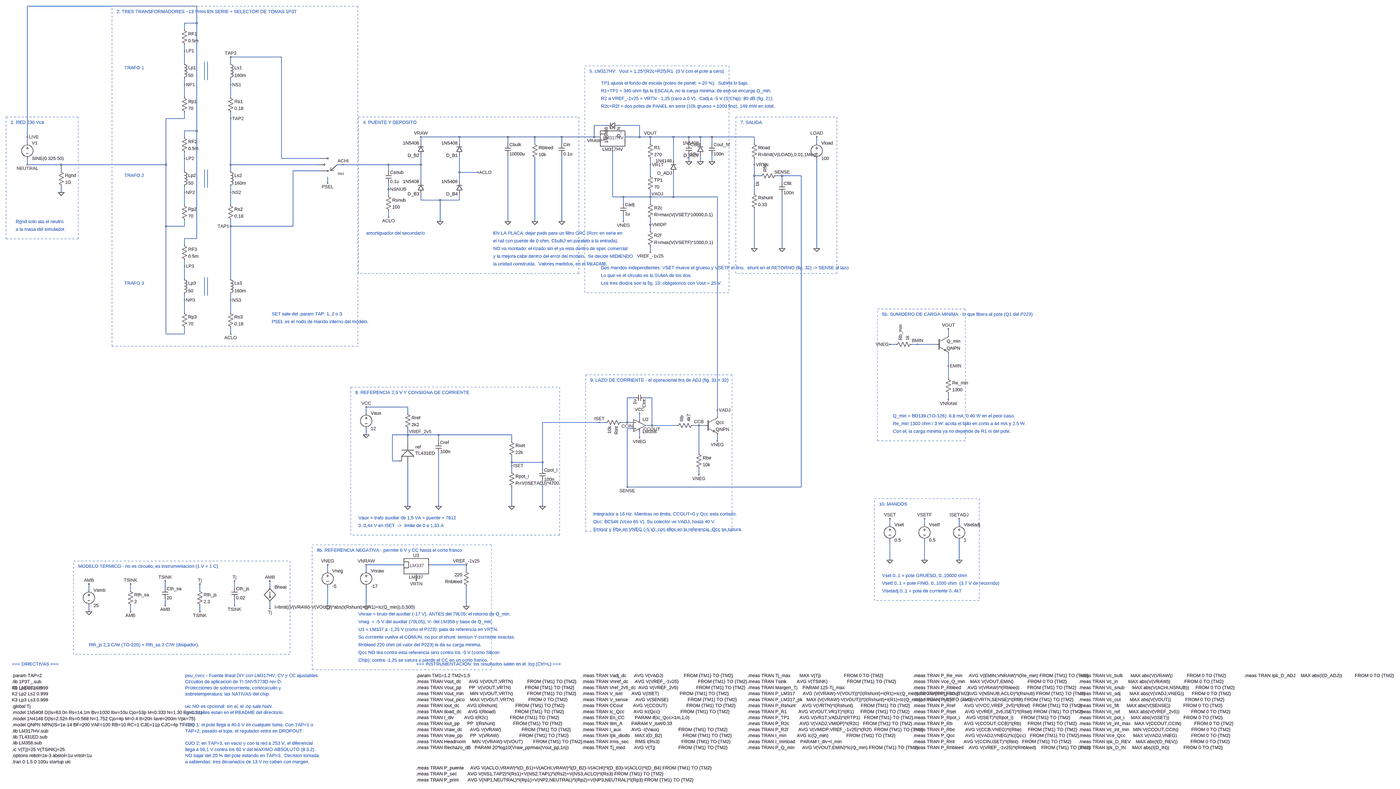
[diagram p0: schematic psu_cvcc.asc, whole sheet]
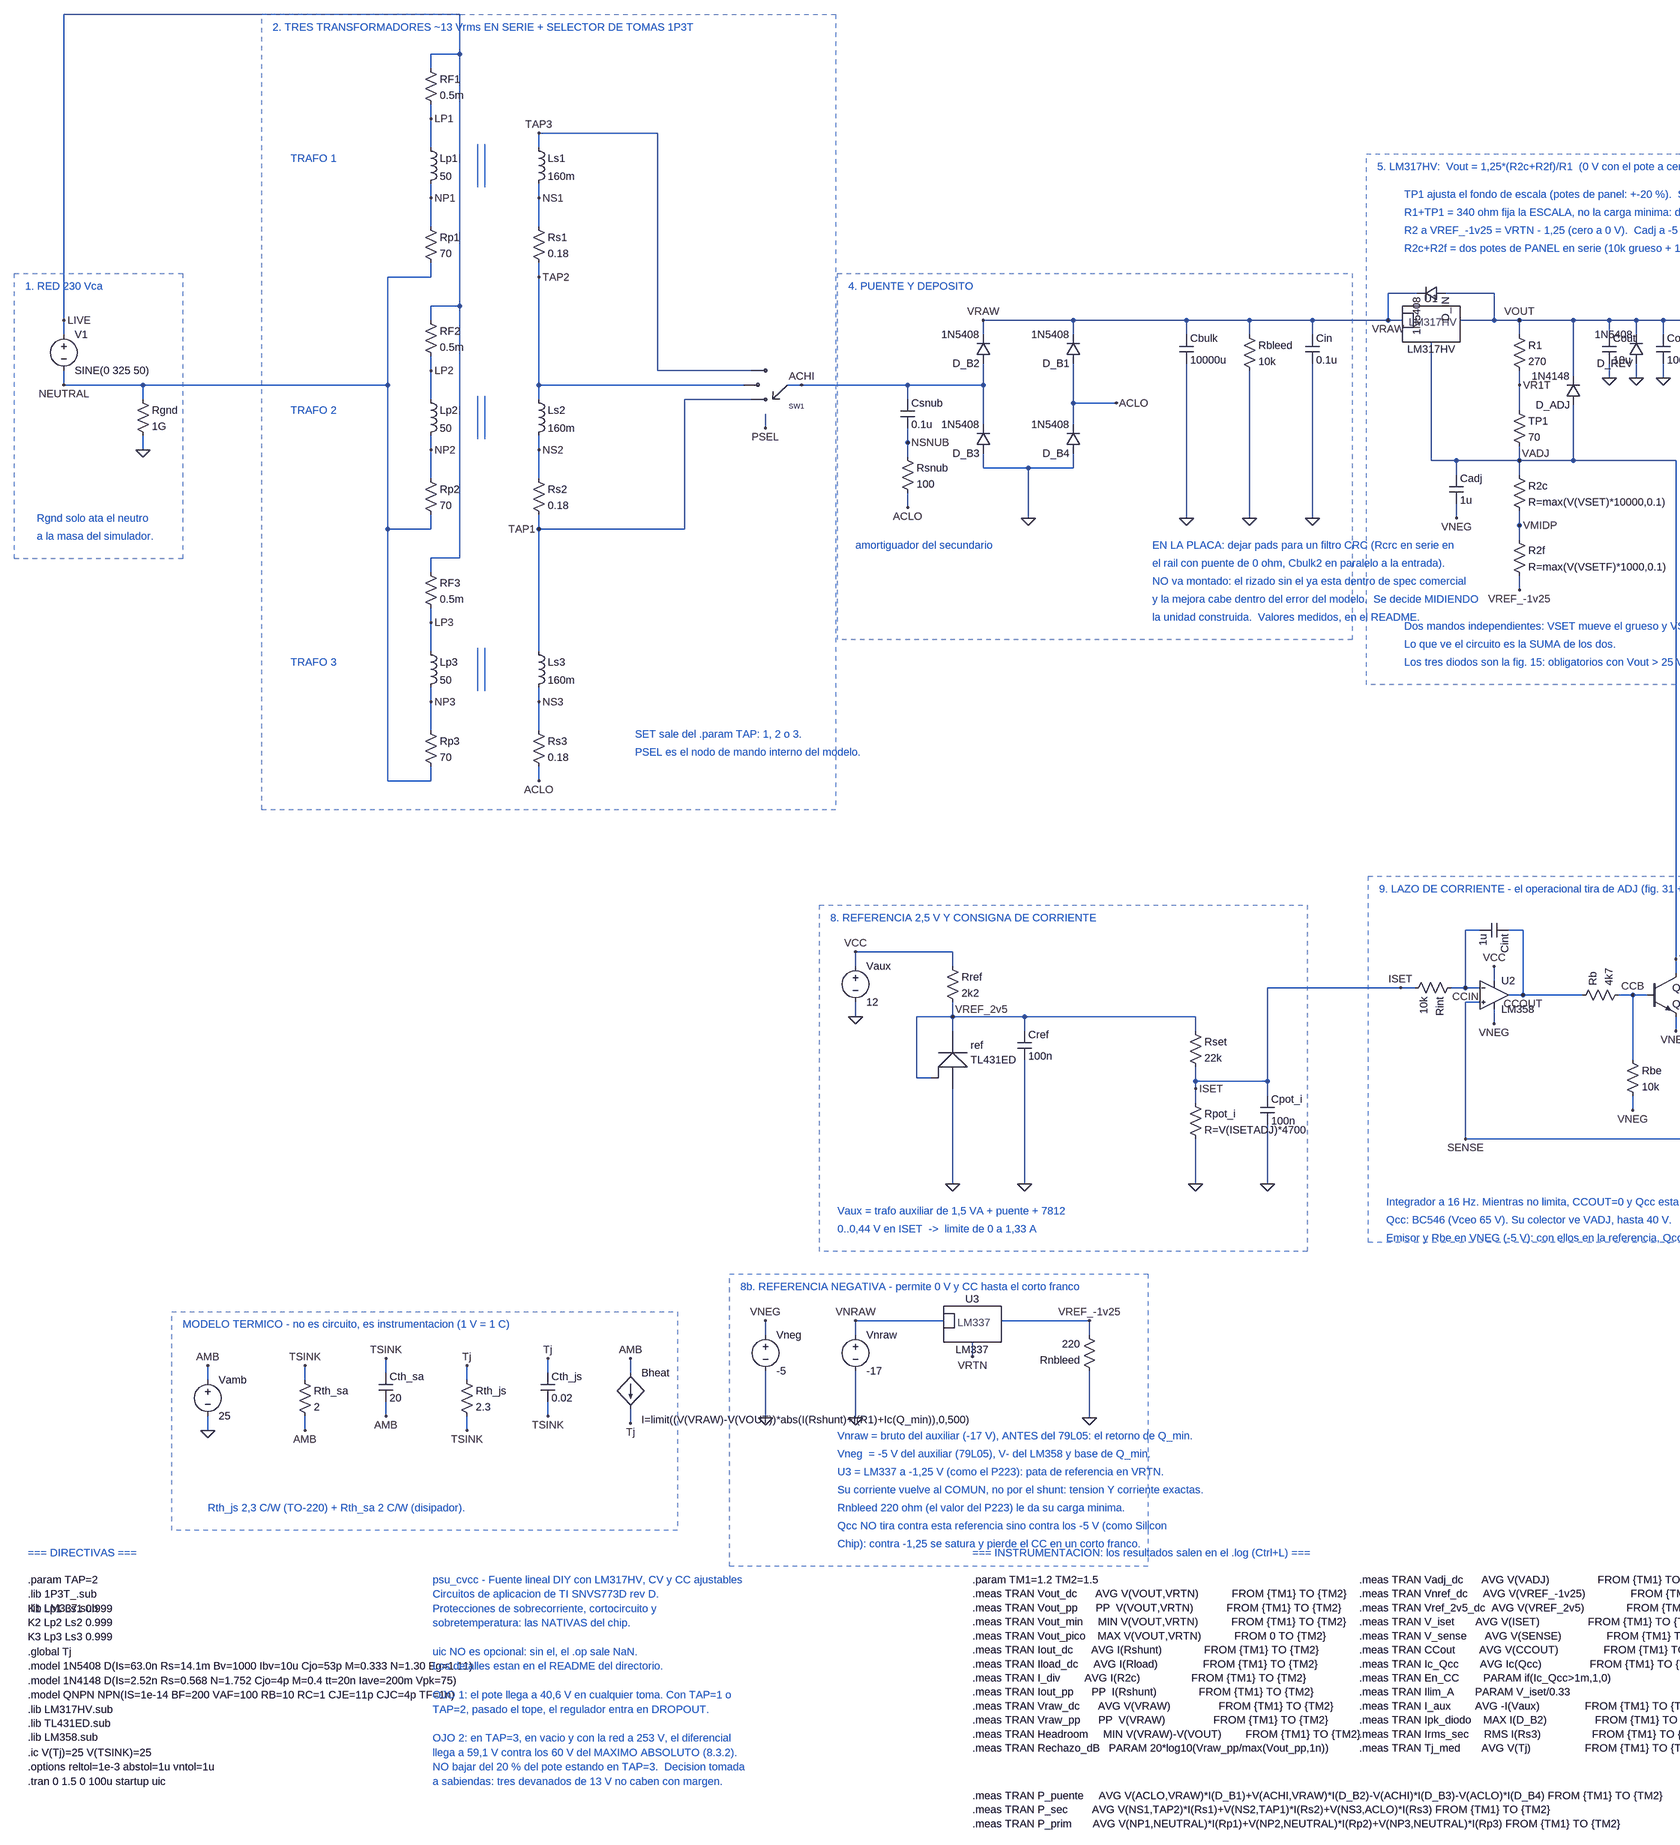
[diagram p1: schematic psu_cvcc.asc, part, row 1 of 1, column 1 of 2]
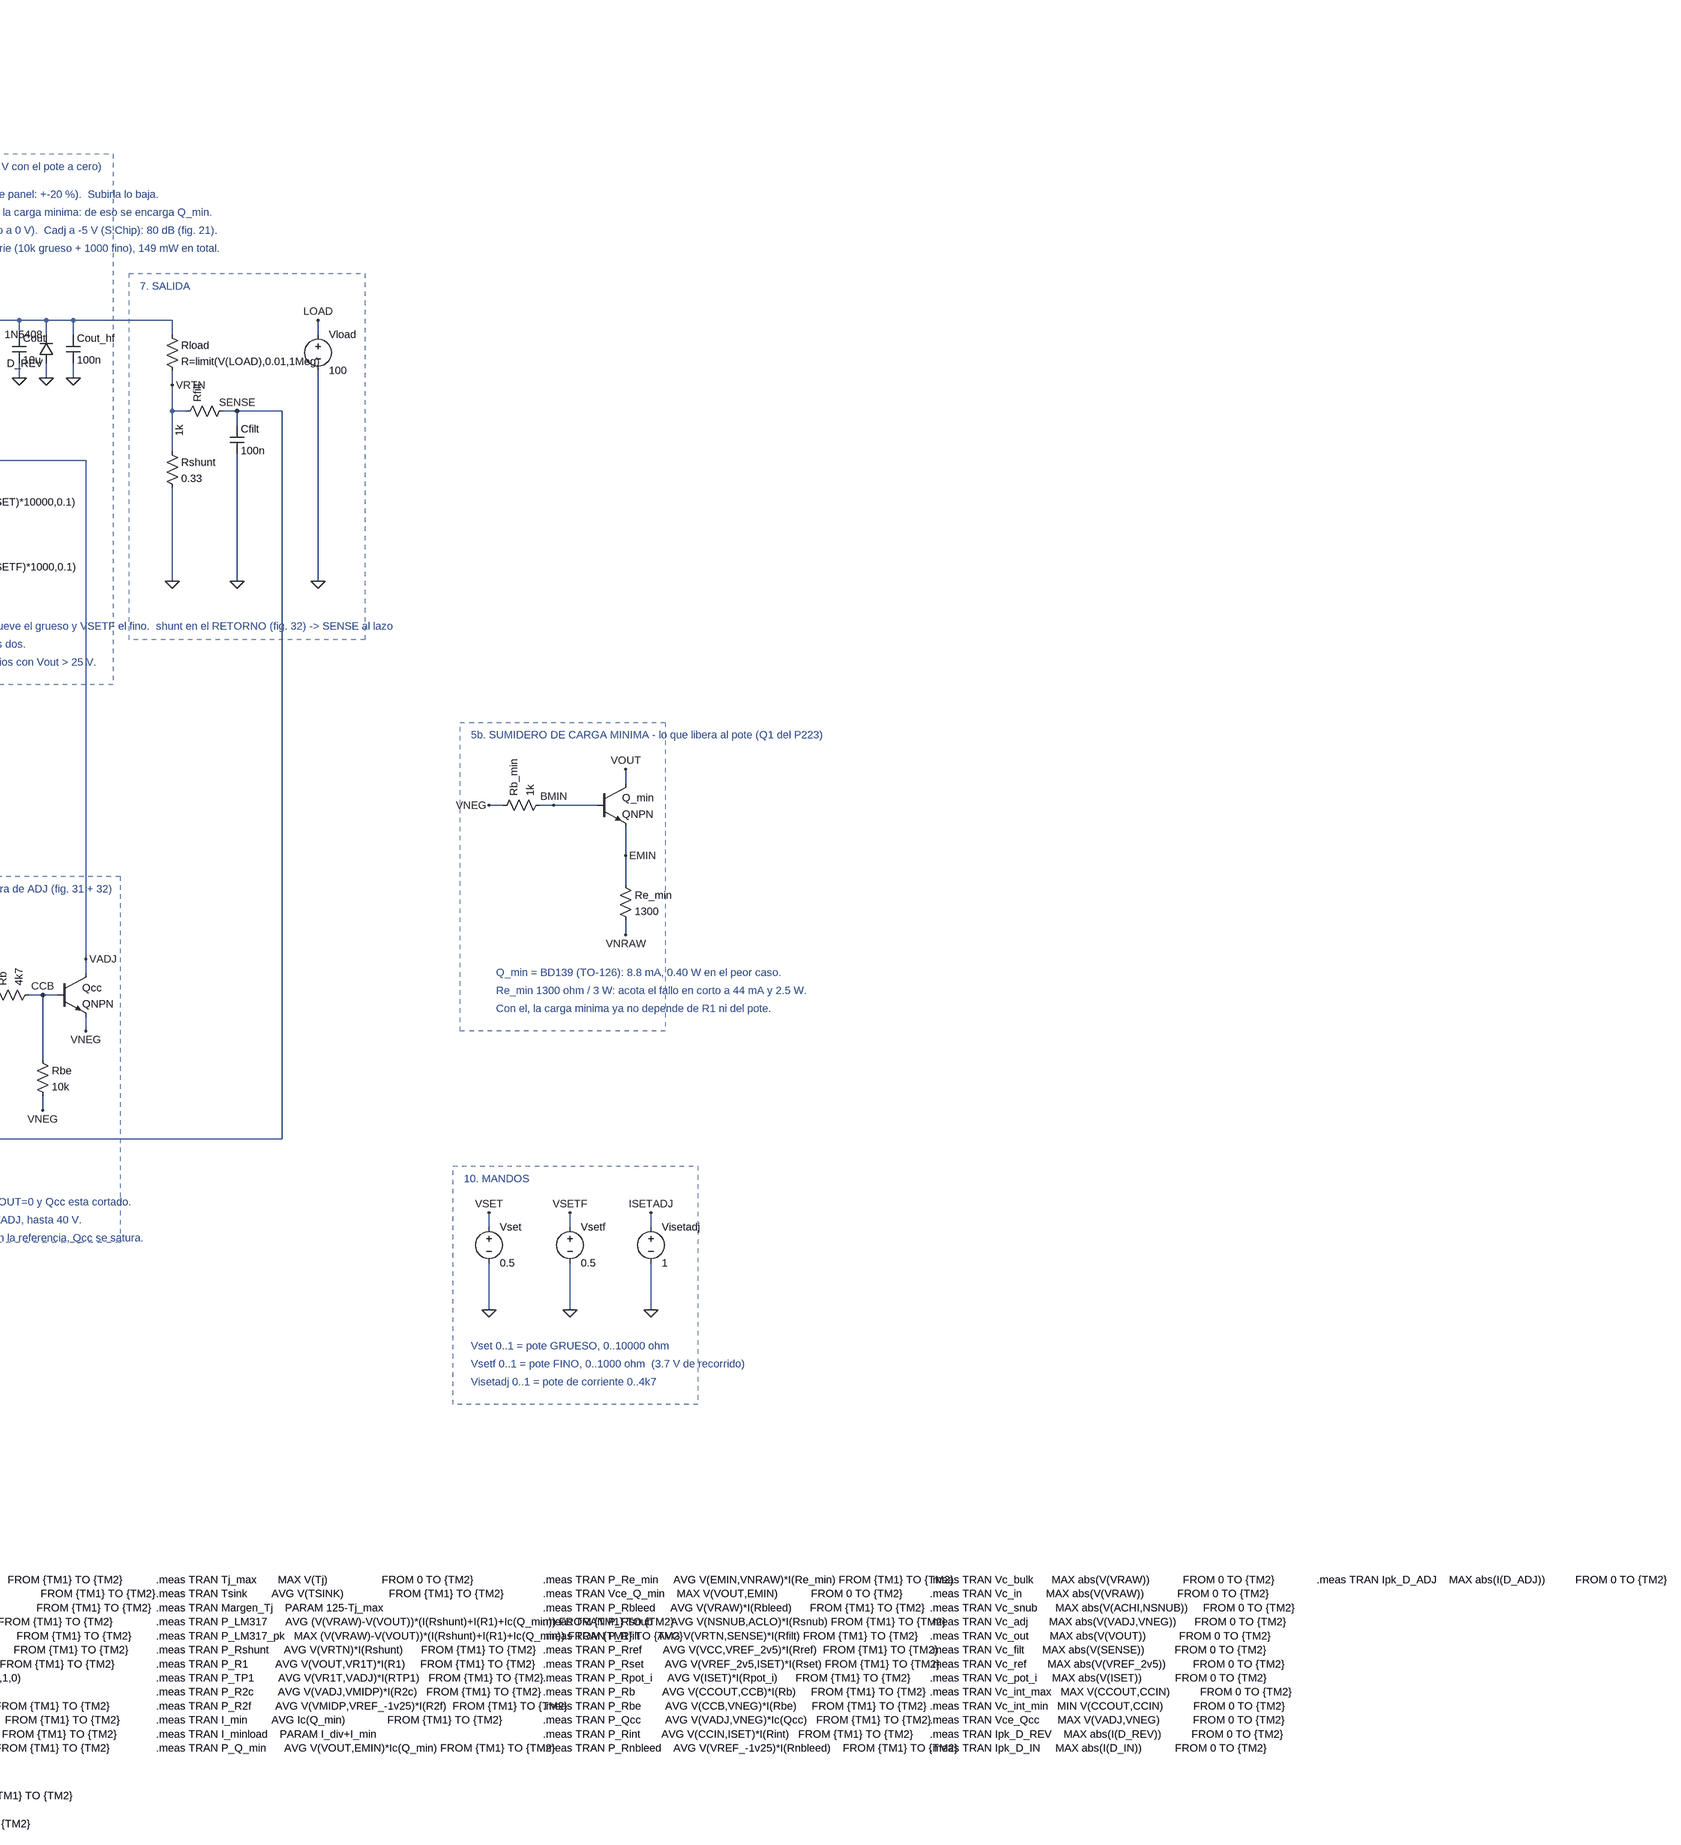
[diagram p2: schematic psu_cvcc.asc, part, row 1 of 1, column 2 of 2]
psu_cvcc.asc, the LTspice schematic file:
Version 4
SHEET 1 5200 4400
WIRE -320 592 -320 560
WIRE -320 672 -320 704
WIRE -144 736 -144 704
WIRE -144 816 -144 848
WIRE 496 0 496 -32
WIRE 496 80 496 112
WIRE 496 176 496 144
WIRE 496 256 496 288
WIRE 496 352 496 320
WIRE 496 432 496 464
WIRE 736 176 736 144
WIRE 736 256 736 288
WIRE 736 352 736 320
WIRE 736 432 736 464
WIRE 496 112 496 144
WIRE 496 288 496 320
WIRE 736 288 736 320
WIRE 496 560 496 528
WIRE 496 640 496 672
WIRE 496 736 496 704
WIRE 496 816 496 848
WIRE 496 912 496 880
WIRE 496 992 496 1024
WIRE 736 736 736 704
WIRE 736 816 736 848
WIRE 736 912 736 880
WIRE 736 992 736 1024
WIRE 496 672 496 704
WIRE 496 848 496 880
WIRE 736 848 736 880
WIRE 496 1120 496 1088
WIRE 496 1200 496 1232
WIRE 496 1296 496 1264
WIRE 496 1376 496 1408
WIRE 496 1472 496 1440
WIRE 496 1552 496 1584
WIRE 736 1296 736 1264
WIRE 736 1376 736 1408
WIRE 736 1472 736 1440
WIRE 736 1552 736 1584
WIRE 496 1232 496 1264
WIRE 496 1408 496 1440
WIRE 736 1408 736 1440
WIRE 400 464 400 704
WIRE 400 704 400 1024
WIRE 400 1024 400 1584
WIRE 560 -32 560 528
WIRE 560 528 560 1088
WIRE 560 -32 496 -32
WIRE 400 464 496 464
WIRE 560 528 496 528
WIRE 400 1024 496 1024
WIRE 560 1088 496 1088
WIRE 400 1584 496 1584
WIRE 736 464 736 704
WIRE 736 1024 736 1264
WIRE 1288 704 1320 704
WIRE 1208 736 1176 736
WIRE 1192 704 1160 704
WIRE 1208 672 1176 672
WIRE 1240 768 1240 800
WIRE 736 144 1000 144
WIRE 1000 144 1000 672
WIRE 1000 672 1176 672
WIRE 736 704 1160 704
WIRE 736 1024 1060 1024
WIRE 1060 1024 1060 736
WIRE 1060 736 1176 736
WIRE 1724 656 1724 688
WIRE 1724 592 1724 560
WIRE 1724 856 1724 888
WIRE 1724 792 1724 760
WIRE 1924 656 1924 688
WIRE 1924 592 1924 560
WIRE 1924 856 1924 888
WIRE 1924 792 1924 760
WIRE 2176 592 2176 560
WIRE 2176 656 2176 688
WIRE 2316 592 2316 560
WIRE 2316 672 2316 704
WIRE 2456 592 2456 560
WIRE 2456 656 2456 688
WIRE 1724 760 1724 704
WIRE 1724 704 1724 688
WIRE 1924 760 1924 744
WIRE 1924 744 1924 688
WIRE 1924 744 2020 744
WIRE 1724 560 1924 560
WIRE 1924 560 2176 560
WIRE 2176 560 2316 560
WIRE 2316 560 2456 560
WIRE 1724 888 1824 888
WIRE 1824 888 1924 888
WIRE 1824 888 1824 1000
WIRE 2176 688 2176 1000
WIRE 2316 704 2316 1000
WIRE 2456 688 2456 1000
WIRE 1556 736 1556 704
WIRE 1556 800 1556 832
WIRE 1556 864 1556 832
WIRE 1556 944 1556 976
WIRE 1556 832 1556 832
WIRE 2720 608 2720 640
WIRE 2784 560 2816 560
WIRE 2656 560 2624 560
WIRE 2916 592 2916 560
WIRE 2916 672 2916 704
WIRE 2916 760 2916 728
WIRE 2916 840 2916 872
WIRE 2916 904 2916 872
WIRE 2916 984 2916 1016
WIRE 2916 1048 2916 1016
WIRE 2916 1128 2916 1160
WIRE 2776 904 2776 872
WIRE 2776 968 2776 1000
WIRE 2916 704 2916 728
WIRE 2916 872 2916 872
WIRE 2916 1016 2916 1016
WIRE 2720 640 2720 872
WIRE 2720 872 2776 872
WIRE 3116 592 3116 560
WIRE 3116 656 3116 688
WIRE 3236 592 3236 560
WIRE 3236 656 3236 688
WIRE 2752 500 2784 500
WIRE 2688 500 2656 500
WIRE 3036 748 3036 780
WIRE 3036 684 3036 652
WIRE 3176 656 3176 688
WIRE 3176 592 3176 560
WIRE 2816 560 2860 560
WIRE 2860 560 2916 560
WIRE 2916 560 3036 560
WIRE 3036 560 3116 560
WIRE 3116 560 3176 560
WIRE 3176 560 3236 560
WIRE 3036 560 3036 652
WIRE 2860 560 2860 500
WIRE 2860 500 2784 500
WIRE 2656 500 2624 500
WIRE 2624 500 2624 560
WIRE 2776 872 2916 872
WIRE 2916 872 3036 872
WIRE 3036 872 3036 780
WIRE 4192 1638 4160 1638
WIRE 4272 1638 4304 1638
WIRE 4464 1590 4464 1558
WIRE 4400 1638 4368 1638
WIRE 4464 1686 4464 1718
WIRE 4464 1814 4464 1782
WIRE 4464 1894 4464 1926
WIRE 4304 1638 4368 1638
WIRE 4464 1718 4464 1750
WIRE 4464 1750 4464 1782
WIRE 3456 592 3456 560
WIRE 3456 672 3456 704
WIRE 3456 852 3456 820
WIRE 3456 932 3456 964
WIRE 3488 762 3456 762
WIRE 3568 762 3600 762
WIRE 3600 794 3600 762
WIRE 3600 858 3600 890
WIRE 3780 592 3780 560
WIRE 3780 672 3780 704
WIRE 3456 704 3456 762
WIRE 3456 762 3456 820
WIRE 3456 762 3456 762
WIRE 3600 762 3600 762
WIRE 3456 964 3456 1140
WIRE 3600 890 3600 1140
WIRE 3780 704 3780 1140
WIRE 1440 1996 1440 1964
WIRE 1440 2076 1440 2108
WIRE 1656 1996 1656 1964
WIRE 1656 2076 1656 2108
WIRE 1656 2140 1656 2108
WIRE 1656 2268 1656 2300
WIRE 1608 2244 1576 2244
WIRE 1816 2140 1816 2108
WIRE 1816 2204 1816 2236
WIRE 2196 2140 2196 2108
WIRE 2196 2220 2196 2252
WIRE 2196 2300 2196 2268
WIRE 2196 2380 2196 2412
WIRE 2356 2284 2356 2252
WIRE 2356 2348 2356 2380
WIRE 1440 1964 1656 1964
WIRE 1656 2108 1656 2108
WIRE 1656 2108 1816 2108
WIRE 1816 2108 2196 2108
WIRE 1576 2244 1576 2108
WIRE 1576 2108 1656 2108
WIRE 2196 2252 2196 2268
WIRE 2196 2252 2356 2252
WIRE 1656 2300 1656 2480
WIRE 1816 2236 1816 2480
WIRE 2196 2412 2196 2480
WIRE 2356 2380 2356 2480
WIRE 3264 2012 3264 1980
WIRE 3200 2060 3168 2060
WIRE 3264 2108 3264 2140
WIRE 3056 2060 3024 2060
WIRE 3136 2060 3168 2060
WIRE 2828 2076 2796 2076
WIRE 2828 2044 2796 2044
WIRE 2860 2028 2860 1996
WIRE 2860 2092 2860 2124
WIRE 2892 2060 2924 2060
WIRE 2764 2044 2796 2044
WIRE 2684 2044 2652 2044
WIRE 2892 1916 2924 1916
WIRE 2828 1916 2796 1916
WIRE 3168 2204 3168 2172
WIRE 3168 2284 3168 2316
WIRE 2924 1916 2924 2060
WIRE 2796 1916 2796 2044
WIRE 2924 2060 3024 2060
WIRE 3168 2060 3168 2172
WIRE 2796 2076 2796 2380
WIRE 1240 2816 1240 2784
WIRE 1240 2896 1240 2928
WIRE 1440 2816 1440 2784
WIRE 1440 2896 1440 2928
WIRE 1700 2832 1700 2864
WIRE 1764 2784 1796 2784
WIRE 1636 2784 1604 2784
WIRE 1960 2896 1960 2928
WIRE 1960 2816 1960 2784
WIRE 1440 2784 1604 2784
WIRE 1796 2784 1960 2784
WIRE 1240 2928 1240 3000
WIRE 1440 2928 1440 3000
WIRE 1960 2928 1960 3000
WIRE 4160 2576 4160 2544
WIRE 4160 2656 4160 2688
WIRE 4340 2576 4340 2544
WIRE 4340 2656 4340 2688
WIRE 4520 2576 4520 2544
WIRE 4520 2656 4520 2688
WIRE 4160 2688 4160 2760
WIRE 4340 2688 4340 2760
WIRE 4520 2688 4520 2760
WIRE 0 2916 0 2884
WIRE 0 2996 0 3028
WIRE 216 2916 216 2884
WIRE 216 2996 216 3028
WIRE 396 2900 396 2868
WIRE 396 2964 396 2996
WIRE 576 2916 576 2884
WIRE 576 2996 576 3028
WIRE 756 2900 756 2868
WIRE 756 2964 756 2996
WIRE 940 2900 940 2868
WIRE 940 2980 940 3012
WIRE 2456 560 2624 560
WIRE 3236 560 3456 560
WIRE 1320 704 1556 704
WIRE 1556 704 1724 704
WIRE -320 704 -144 704
WIRE -144 704 400 704
WIRE -320 560 -320 -120
WIRE -320 -120 560 -120
WIRE 560 -120 560 -32
WIRE 2356 2252 2356 2044
WIRE 2356 2044 2652 2044
WIRE 3600 762 3700 762
WIRE 3700 762 3700 2380
WIRE 3700 2380 2796 2380
WIRE 3264 1980 3264 872
WIRE 3264 872 3036 872
FLAG -320 560 LIVE
FLAG -320 704 NEUTRAL
FLAG -144 848 0
FLAG 496 112 LP1
FLAG 496 288 NP1
FLAG 736 144 TAP3
FLAG 736 288 NS1
FLAG 736 464 TAP2
FLAG 496 672 LP2
FLAG 496 848 NP2
FLAG 736 848 NS2
FLAG 736 1024 TAP1
FLAG 496 1232 LP3
FLAG 496 1408 NP3
FLAG 736 1408 NS3
FLAG 736 1584 ACLO
FLAG 1320 704 ACHI
FLAG 1240 800 PSEL
FLAG 1724 560 VRAW
FLAG 2020 744 ACLO
FLAG 1824 1000 0
FLAG 2176 1000 0
FLAG 2316 1000 0
FLAG 2456 1000 0
FLAG 1556 832 NSNUB
FLAG 1556 976 ACLO
FLAG 2624 560 VRAW
FLAG 2916 560 VOUT
FLAG 2916 704 VR1T
FLAG 2916 872 VADJ
FLAG 2916 1016 VMIDP
FLAG 2916 1160 VREF_-1v25
FLAG 2776 1000 VNEG
FLAG 3116 688 0
FLAG 3236 688 0
FLAG 3176 688 0
FLAG 4160 1638 VNEG
FLAG 4464 1558 VOUT
FLAG 4464 1926 VNRAW
FLAG 4304 1638 BMIN
FLAG 4464 1750 EMIN
FLAG 3456 704 VRTN
FLAG 3600 762 SENSE
FLAG 3780 560 LOAD
FLAG 3456 1140 0
FLAG 3600 1140 0
FLAG 3780 1140 0
FLAG 1440 1964 VCC
FLAG 1656 2108 VREF_2v5
FLAG 2196 2268 ISET
FLAG 1656 2480 0
FLAG 1816 2480 0
FLAG 2196 2480 0
FLAG 2356 2480 0
FLAG 1440 2108 0
FLAG 3264 1980 VADJ
FLAG 3168 2060 CCB
FLAG 3264 2140 VNEG
FLAG 2796 2044 CCIN
FLAG 2860 1996 VCC
FLAG 2860 2124 VNEG
FLAG 2924 2060 CCOUT
FLAG 2652 2044 ISET
FLAG 3168 2316 VNEG
FLAG 2796 2380 SENSE
FLAG 1240 2784 VNEG
FLAG 1440 2784 VNRAW
FLAG 1960 2784 VREF_-1v25
FLAG 1700 2864 VRTN
FLAG 1240 3000 0
FLAG 1440 3000 0
FLAG 1960 3000 0
FLAG 4160 2544 VSET
FLAG 4340 2544 VSETF
FLAG 4520 2544 ISETADJ
FLAG 4160 2760 0
FLAG 4340 2760 0
FLAG 4520 2760 0
FLAG 0 2884 AMB
FLAG 0 3028 0
FLAG 216 2884 TSINK
FLAG 216 3028 AMB
FLAG 396 2868 TSINK
FLAG 396 2996 AMB
FLAG 576 2884 Tj
FLAG 576 3028 TSINK
FLAG 756 2868 Tj
FLAG 756 2996 TSINK
FLAG 940 2868 AMB
FLAG 940 3012 Tj
SYMBOL voltage -320 576 R0
SYMATTR InstName V1
SYMATTR Value SINE(0 325 50)
SYMBOL res -160 720 R0
SYMATTR InstName Rgnd
SYMATTR Value 1G
SYMBOL res 480 -16 R0
SYMATTR InstName RF1
SYMATTR Value 0.5m
SYMBOL ind 480 160 R0
SYMATTR InstName Lp1
SYMATTR Value 50
SYMBOL res 480 336 R0
SYMATTR InstName Rp1
SYMATTR Value 70
SYMBOL ind 720 160 R0
SYMATTR InstName Ls1
SYMATTR Value 160m
SYMBOL res 720 336 R0
SYMATTR InstName Rs1
SYMATTR Value 0.18
SYMBOL res 480 544 R0
SYMATTR InstName RF2
SYMATTR Value 0.5m
SYMBOL ind 480 720 R0
SYMATTR InstName Lp2
SYMATTR Value 50
SYMBOL res 480 896 R0
SYMATTR InstName Rp2
SYMATTR Value 70
SYMBOL ind 720 720 R0
SYMATTR InstName Ls2
SYMATTR Value 160m
SYMBOL res 720 896 R0
SYMATTR InstName Rs2
SYMATTR Value 0.18
SYMBOL res 480 1104 R0
SYMATTR InstName RF3
SYMATTR Value 0.5m
SYMBOL ind 480 1280 R0
SYMATTR InstName Lp3
SYMATTR Value 50
SYMBOL res 480 1456 R0
SYMATTR InstName Rp3
SYMATTR Value 70
SYMBOL ind 720 1280 R0
SYMATTR InstName Ls3
SYMATTR Value 160m
SYMBOL res 720 1456 R0
SYMATTR InstName Rs3
SYMATTR Value 0.18
SYMBOL 1P3T_ 1240 704 M180
SYMATTR InstName SW1
SYMATTR Value SET={TAP} Ron=10m
SYMBOL diode 1740 656 R180
SYMATTR InstName D_B2
SYMATTR Value 1N5408
SYMBOL diode 1740 856 R180
SYMATTR InstName D_B3
SYMATTR Value 1N5408
SYMBOL diode 1940 656 R180
SYMATTR InstName D_B1
SYMATTR Value 1N5408
SYMBOL diode 1940 856 R180
SYMATTR InstName D_B4
SYMATTR Value 1N5408
SYMBOL cap 2160 592 R0
SYMATTR InstName Cbulk
SYMATTR Value 10000u
SYMBOL res 2300 576 R0
SYMATTR InstName Rbleed
SYMATTR Value 10k
SYMBOL cap 2440 592 R0
SYMATTR InstName Cin
SYMATTR Value 0.1u
SYMBOL cap 1540 736 R0
SYMATTR InstName Csnub
SYMATTR Value 0.1u
SYMBOL res 1540 848 R0
SYMATTR InstName Rsnub
SYMATTR Value 100
SYMBOL LM317HV 2720 560 R0
SYMATTR InstName U1
SYMBOL res 2900 576 R0
SYMATTR InstName R1
SYMATTR Value 270
SYMBOL res 2900 744 R0
SYMATTR InstName TP1
SYMATTR Value 70
SYMBOL res 2900 888 R0
SYMATTR InstName R2c
SYMATTR Value R=max(V(VSET)*10000,0.1)
SYMBOL res 2900 1032 R0
SYMATTR InstName R2f
SYMATTR Value R=max(V(VSETF)*1000,0.1)
SYMBOL cap 2760 904 R0
SYMATTR InstName Cadj
SYMATTR Value 1u
SYMBOL cap 3100 592 R0
SYMATTR InstName Cout
SYMATTR Value 10u
SYMBOL cap 3220 592 R0
SYMATTR InstName Cout_hf
SYMATTR Value 100n
SYMBOL diode 2752 484 R90
SYMATTR InstName D_IN
SYMATTR Value 1N5408
SYMBOL diode 3052 748 R180
SYMATTR InstName D_ADJ
SYMATTR Value 1N4148
SYMBOL diode 3192 656 R180
SYMATTR InstName D_REV
SYMATTR Value 1N5408
SYMBOL res 4176 1654 R270
SYMATTR InstName Rb_min
SYMATTR Value 1k
SYMBOL npn 4400 1590 R0
SYMATTR InstName Q_min
SYMATTR Value QNPN
SYMBOL res 4448 1798 R0
SYMATTR InstName Re_min
SYMATTR Value 1300
SYMBOL res 3440 576 R0
SYMATTR InstName Rload
SYMATTR Value R=limit(V(LOAD),0.01,1Meg)
SYMBOL res 3440 836 R0
SYMATTR InstName Rshunt
SYMATTR Value 0.33
SYMBOL res 3472 778 R270
WINDOW 3 -40 0 Left 2
SYMATTR InstName Rfilt
SYMATTR Value 1k
SYMBOL cap 3584 794 R0
SYMATTR InstName Cfilt
SYMATTR Value 100n
SYMBOL voltage 3780 576 R0
SYMATTR InstName Vload
SYMATTR Value 100
SYMBOL voltage 1440 1980 R0
SYMATTR InstName Vaux
SYMATTR Value 12
SYMBOL res 1640 1980 R0
SYMATTR InstName Rref
SYMATTR Value 2k2
SYMBOL TL431ED 1656 2204 R0
SYMATTR InstName ref
SYMBOL cap 1800 2140 R0
SYMATTR InstName Cref
SYMATTR Value 100n
SYMBOL res 2180 2124 R0
SYMATTR InstName Rset
SYMATTR Value 22k
SYMBOL res 2180 2284 R0
SYMATTR InstName Rpot_i
SYMATTR Value R=V(ISETADJ)*4700
SYMBOL cap 2340 2284 R0
SYMATTR InstName Cpot_i
SYMATTR Value 100n
SYMBOL npn 3200 2012 R0
SYMATTR InstName Qcc
SYMATTR Value QNPN
SYMBOL res 3040 2076 R270
SYMATTR InstName Rb
SYMATTR Value 4k7
SYMBOL LM358 2860 2060 R0
SYMATTR InstName U2
SYMBOL res 2780 2028 R90
SYMATTR InstName Rint
SYMATTR Value 10k
SYMBOL cap 2892 1900 R90
SYMATTR InstName Cint
SYMATTR Value 1u
SYMBOL res 3152 2188 R0
SYMATTR InstName Rbe
SYMATTR Value 10k
SYMBOL voltage 1240 2800 R0
SYMATTR InstName Vneg
SYMATTR Value -5
SYMBOL voltage 1440 2800 R0
SYMATTR InstName Vnraw
SYMATTR Value -17
SYMBOL LM337 1700 2784 R0
SYMATTR InstName U3
SYMBOL res 1976 2912 R180
SYMATTR InstName Rnbleed
SYMATTR Value 220
SYMBOL voltage 4160 2560 R0
SYMATTR InstName Vset
SYMATTR Value 0.5
SYMBOL voltage 4340 2560 R0
SYMATTR InstName Vsetf
SYMATTR Value 0.5
SYMBOL voltage 4520 2560 R0
SYMATTR InstName Visetadj
SYMATTR Value 1
SYMBOL voltage 0 2900 R0
SYMATTR InstName Vamb
SYMATTR Value 25
SYMBOL res 200 2900 R0
SYMATTR InstName Rth_sa
SYMATTR Value 2
SYMBOL cap 380 2900 R0
SYMATTR InstName Cth_sa
SYMATTR Value 20
SYMBOL res 560 2900 R0
SYMATTR InstName Rth_js
SYMATTR Value 2.3
SYMBOL cap 740 2900 R0
SYMATTR InstName Cth_js
SYMATTR Value 0.02
SYMBOL bi 940 2900 R0
WINDOW 3 24 104 Left 2
SYMATTR InstName Bheat
SYMATTR Value I=limit((V(VRAW)-V(VOUT))*abs(I(Rshunt)+I(R1)+Ic(Q_min)),0,500)
TEXT -380 1000 Left 2 ;Rgnd solo ata el neutro
TEXT -380 1040 Left 2 ;a la masa del simulador.
TEXT 184 200 Left 2 ;TRAFO 1
TEXT 184 760 Left 2 ;TRAFO 2
TEXT 184 1320 Left 2 ;TRAFO 3
TEXT 950 1480 Left 2 ;SET sale del .param TAP: 1, 2 o 3.
TEXT 950 1520 Left 2 ;PSEL es el nodo de mando interno del modelo.
TEXT 1440 1060 Left 2 ;amortiguador del secundario
TEXT 2100 1060 Left 2 ;EN LA PLACA: dejar pads para un filtro CRC (Rcrc en serie en
TEXT 2100 1100 Left 2 ;el rail con puente de 0 ohm, Cbulk2 en paralelo a la entrada).
TEXT 2100 1140 Left 2 ;NO va montado: el rizado sin el ya esta dentro de spec comercial
TEXT 2100 1180 Left 2 ;y la mejora cabe dentro del error del modelo.  Se decide MIDIENDO
TEXT 2100 1220 Left 2 ;la unidad construida.  Valores medidos, en el README.
TEXT 2660 400 Left 2 ;R2c+R2f = dos potes de PANEL en serie (10k grueso + 1000 fino), 149 mW en total.
TEXT 2660 360 Left 2 ;R2 a VREF_-1v25 = VRTN - 1,25 (cero a 0 V).  Cadj a -5 V (S.Chip): 80 dB (fig. 21).
TEXT 2660 320 Left 2 ;R1+TP1 = 340 ohm fija la ESCALA, no la carga minima: de eso se encarga Q_min.
TEXT 2660 280 Left 2 ;TP1 ajusta el fondo de escala (potes de panel: +-20 %).  Subirla lo baja.
TEXT 2660 1320 Left 2 ;Los tres diodos son la fig. 15: obligatorios con Vout > 25 V.
TEXT 2660 1240 Left 2 ;Dos mandos independientes: VSET mueve el grueso y VSETF el fino.
TEXT 2660 1280 Left 2 ;Lo que ve el circuito es la SUMA de los dos.
TEXT 4176 2010 Left 2 ;Q_min = BD139 (TO-126): 8.8 mA, 0.40 W en el peor caso.
TEXT 4176 2050 Left 2 ;Re_min 1300 ohm / 3 W: acota el fallo en corto a 44 mA y 2.5 W.
TEXT 4176 2090 Left 2 ;Con el, la carga minima ya no depende de R1 ni del pote.
TEXT 3420 1240 Left 2 ;shunt en el RETORNO (fig. 32) -> SENSE al lazo
TEXT 1400 2540 Left 2 ;Vaux = trafo auxiliar de 1,5 VA + puente + 7812
TEXT 1400 2580 Left 2 ;0..0,44 V en ISET  ->  limite de 0 a 1,33 A
TEXT 2620 2520 Left 2 ;Integrador a 16 Hz. Mientras no limita, CCOUT=0 y Qcc esta cortado.
TEXT 2620 2560 Left 2 ;Qcc: BC546 (Vceo 65 V). Su colector ve VADJ, hasta 40 V.
TEXT 2620 2600 Left 2 ;Emisor y Rbe en VNEG (-5 V): con ellos en la referencia, Qcc se satura.
TEXT 1400 3040 Left 2 ;Vnraw = bruto del auxiliar (-17 V), ANTES del 79L05: el retorno de Q_min.
TEXT 1400 3080 Left 2 ;Vneg  = -5 V del auxiliar (79L05), V- del LM358 y base de Q_min.
TEXT 1400 3120 Left 2 ;U3 = LM337 a -1,25 V (como el P223): pata de referencia en VRTN.
TEXT 1400 3160 Left 2 ;Su corriente vuelve al COMUN, no por el shunt: tension Y corriente exactas.
TEXT 1400 3200 Left 2 ;Rnbleed 220 ohm (el valor del P223) le da su carga minima.
TEXT 1400 3240 Left 2 ;Qcc NO tira contra esta referencia sino contra los -5 V (como Silicon
TEXT 1400 3280 Left 2 ;Chip): contra -1,25 se satura y pierde el CC en un corto franco.
TEXT 4120 2840 Left 2 ;Vset 0..1 = pote GRUESO, 0..10000 ohm
TEXT 4120 2880 Left 2 ;Vsetf 0..1 = pote FINO, 0..1000 ohm  (3.7 V de recorrido)
TEXT 4120 2920 Left 2 ;Visetadj 0..1 = pote de corriente 0..4k7
TEXT 0 3200 Left 2 ;Rth_js 2,3 C/W (TO-220) + Rth_sa 2 C/W (disipador).
TEXT -400 3300 Left 2 ;=== DIRECTIVAS ===
TEXT -400 3360 Left 2 !.param TAP=2
TEXT -400 3392 Left 2 !.lib 1P3T_.sub\n.lib LM337.sub
TEXT -400 3424 Left 2 !K1 Lp1 Ls1 0.999\nK2 Lp2 Ls2 0.999\nK3 Lp3 Ls3 0.999
TEXT -400 3520 Left 2 !.global Tj
TEXT -400 3552 Left 2 !.model 1N5408 D(Is=63.0n Rs=14.1m Bv=1000 Ibv=10u Cjo=53p M=0.333 N=1.30 Eg=1.11)
TEXT -400 3584 Left 2 !.model 1N4148 D(Is=2.52n Rs=0.568 N=1.752 Cjo=4p M=0.4 tt=20n Iave=200m Vpk=75)
TEXT -400 3616 Left 2 !.model QNPN NPN(IS=1e-14 BF=200 VAF=100 RB=10 RC=1 CJE=11p CJC=4p TF=1n)
TEXT -400 3648 Left 2 !.lib LM317HV.sub\n.lib TL431ED.sub\n.lib LM358.sub
TEXT -400 3744 Left 2 !.ic V(Tj)=25 V(TSINK)=25
TEXT -400 3776 Left 2 !.options reltol=1e-3 abstol=1u vntol=1u
TEXT -400 3808 Left 2 !.tran 0 1.5 0 100u startup uic
TEXT 500 3360 Left 2 ;psu_cvcc - Fuente lineal DIY con LM317HV, CV y CC ajustables
TEXT 500 3392 Left 2 ;Circuitos de aplicacion de TI SNVS773D rev D.
TEXT 500 3424 Left 2 ;Protecciones de sobrecorriente, cortocircuito y
TEXT 500 3456 Left 2 ;sobretemperatura: las NATIVAS del chip.
TEXT 500 3520 Left 2 ;uic NO es opcional: sin el, el .op sale NaN.
TEXT 500 3552 Left 2 ;Los detalles estan en el README del directorio.
TEXT 500 3616 Left 2 ;OJO 1: el pote llega a 40,6 V en cualquier toma. Con TAP=1 o
TEXT 500 3648 Left 2 ;TAP=2, pasado el tope, el regulador entra en DROPOUT.
TEXT 500 3712 Left 2 ;OJO 2: en TAP=3, en vacio y con la red a 253 V, el diferencial
TEXT 500 3744 Left 2 ;llega a 59,1 V contra los 60 V del MAXIMO ABSOLUTO (8.3.2).
TEXT 500 3776 Left 2 ;NO bajar del 20 % del pote estando en TAP=3.  Decision tomada
TEXT 500 3808 Left 2 ;a sabiendas: tres devanados de 13 V no caben con margen.
TEXT 1700 3300 Left 2 ;=== INSTRUMENTACION: los resultados salen en el .log (Ctrl+L) ===
TEXT 1700 3360 Left 2 !.param TM1=1.2 TM2=1.5\n.meas TRAN Vout_dc      AVG V(VOUT,VRTN)           FROM {TM1} TO {TM2}\n.meas TRAN Vout_pp      PP  V(VOUT,VRTN)           FROM {TM1} TO {TM2}\n.meas TRAN Vout_min     MIN V(VOUT,VRTN)           FROM {TM1} TO {TM2}\n.meas TRAN Vout_pico    MAX V(VOUT,VRTN)           FROM 0 TO {TM2}\n.meas TRAN Iout_dc      AVG I(Rshunt)              FROM {TM1} TO {TM2}\n.meas TRAN Iload_dc     AVG I(Rload)               FROM {TM1} TO {TM2}\n.meas TRAN I_div        AVG I(R2c)                 FROM {TM1} TO {TM2}\n.meas TRAN Iout_pp      PP  I(Rshunt)              FROM {TM1} TO {TM2}\n.meas TRAN Vraw_dc      AVG V(VRAW)                FROM {TM1} TO {TM2}\n.meas TRAN Vraw_pp      PP  V(VRAW)                FROM {TM1} TO {TM2}\n.meas TRAN Headroom     MIN V(VRAW)-V(VOUT)        FROM {TM1} TO {TM2}\n.meas TRAN Rechazo_dB   PARAM 20*log10(Vraw_pp/max(Vout_pp,1n))
TEXT 2560 3360 Left 2 !.meas TRAN Vadj_dc      AVG V(VADJ)                FROM {TM1} TO {TM2}\n.meas TRAN Vnref_dc     AVG V(VREF_-1v25)               FROM {TM1} TO {TM2}\n.meas TRAN Vref_2v5_dc  AVG V(VREF_2v5)              FROM {TM1} TO {TM2}\n.meas TRAN V_iset       AVG V(ISET)                FROM {TM1} TO {TM2}\n.meas TRAN V_sense      AVG V(SENSE)               FROM {TM1} TO {TM2}\n.meas TRAN CCout        AVG V(CCOUT)               FROM {TM1} TO {TM2}\n.meas TRAN Ic_Qcc       AVG Ic(Qcc)                FROM {TM1} TO {TM2}\n.meas TRAN En_CC        PARAM if(Ic_Qcc>1m,1,0)\n.meas TRAN Ilim_A       PARAM V_iset/0.33\n.meas TRAN I_aux        AVG -I(Vaux)               FROM {TM1} TO {TM2}\n.meas TRAN Ipk_diodo    MAX I(D_B2)                FROM {TM1} TO {TM2}\n.meas TRAN Irms_sec     RMS I(Rs3)                 FROM {TM1} TO {TM2}\n.meas TRAN Tj_med       AVG V(Tj)                  FROM {TM1} TO {TM2}
TEXT 3420 3360 Left 2 !.meas TRAN Tj_max       MAX V(Tj)                  FROM 0 TO {TM2}\n.meas TRAN Tsink        AVG V(TSINK)               FROM {TM1} TO {TM2}\n.meas TRAN Margen_Tj    PARAM 125-Tj_max\n.meas TRAN P_LM317      AVG (V(VRAW)-V(VOUT))*(I(Rshunt)+I(R1)+Ic(Q_min)) FROM {TM1} TO {TM2}\n.meas TRAN P_LM317_pk   MAX (V(VRAW)-V(VOUT))*(I(Rshunt)+I(R1)+Ic(Q_min)) FROM {TM1} TO {TM2}\n.meas TRAN P_Rshunt     AVG V(VRTN)*I(Rshunt)      FROM {TM1} TO {TM2}\n.meas TRAN P_R1         AVG V(VOUT,VR1T)*I(R1)     FROM {TM1} TO {TM2}\n.meas TRAN P_TP1        AVG V(VR1T,VADJ)*I(RTP1)   FROM {TM1} TO {TM2}\n.meas TRAN P_R2c        AVG V(VADJ,VMIDP)*I(R2c)   FROM {TM1} TO {TM2}\n.meas TRAN P_R2f        AVG V(VMIDP,VREF_-1v25)*I(R2f)  FROM {TM1} TO {TM2}\n.meas TRAN I_min        AVG Ic(Q_min)              FROM {TM1} TO {TM2}\n.meas TRAN I_minload    PARAM I_div+I_min\n.meas TRAN P_Q_min      AVG V(VOUT,EMIN)*Ic(Q_min) FROM {TM1} TO {TM2}
TEXT 4280 3360 Left 2 !.meas TRAN P_Re_min     AVG V(EMIN,VNRAW)*I(Re_min) FROM {TM1} TO {TM2}\n.meas TRAN Vce_Q_min    MAX V(VOUT,EMIN)           FROM 0 TO {TM2}\n.meas TRAN P_Rbleed     AVG V(VRAW)*I(Rbleed)      FROM {TM1} TO {TM2}\n.meas TRAN P_Rsnub      AVG V(NSNUB,ACLO)*I(Rsnub) FROM {TM1} TO {TM2}\n.meas TRAN P_Rfilt      AVG V(VRTN,SENSE)*I(Rfilt) FROM {TM1} TO {TM2}\n.meas TRAN P_Rref       AVG V(VCC,VREF_2v5)*I(Rref)  FROM {TM1} TO {TM2}\n.meas TRAN P_Rset       AVG V(VREF_2v5,ISET)*I(Rset) FROM {TM1} TO {TM2}\n.meas TRAN P_Rpot_i     AVG V(ISET)*I(Rpot_i)      FROM {TM1} TO {TM2}\n.meas TRAN P_Rb         AVG V(CCOUT,CCB)*I(Rb)     FROM {TM1} TO {TM2}\n.meas TRAN P_Rbe        AVG V(CCB,VNEG)*I(Rbe)     FROM {TM1} TO {TM2}\n.meas TRAN P_Qcc        AVG V(VADJ,VNEG)*Ic(Qcc)   FROM {TM1} TO {TM2}\n.meas TRAN P_Rint       AVG V(CCIN,ISET)*I(Rint)   FROM {TM1} TO {TM2}\n.meas TRAN P_Rnbleed    AVG V(VREF_-1v25)*I(Rnbleed)    FROM {TM1} TO {TM2}
TEXT 5140 3360 Left 2 !.meas TRAN Vc_bulk      MAX abs(V(VRAW))           FROM 0 TO {TM2}\n.meas TRAN Vc_in        MAX abs(V(VRAW))           FROM 0 TO {TM2}\n.meas TRAN Vc_snub      MAX abs(V(ACHI,NSNUB))     FROM 0 TO {TM2}\n.meas TRAN Vc_adj       MAX abs(V(VADJ,VNEG))      FROM 0 TO {TM2}\n.meas TRAN Vc_out       MAX abs(V(VOUT))           FROM 0 TO {TM2}\n.meas TRAN Vc_filt      MAX abs(V(SENSE))          FROM 0 TO {TM2}\n.meas TRAN Vc_ref       MAX abs(V(VREF_2v5))         FROM 0 TO {TM2}\n.meas TRAN Vc_pot_i     MAX abs(V(ISET))           FROM 0 TO {TM2}\n.meas TRAN Vc_int_max   MAX V(CCOUT,CCIN)          FROM 0 TO {TM2}\n.meas TRAN Vc_int_min   MIN V(CCOUT,CCIN)          FROM 0 TO {TM2}\n.meas TRAN Vce_Qcc      MAX V(VADJ,VNEG)           FROM 0 TO {TM2}\n.meas TRAN Ipk_D_REV    MAX abs(I(D_REV))          FROM 0 TO {TM2}\n.meas TRAN Ipk_D_IN     MAX abs(I(D_IN))           FROM 0 TO {TM2}
TEXT 6000 3360 Left 2 !.meas TRAN Ipk_D_ADJ    MAX abs(I(D_ADJ))          FROM 0 TO {TM2}
TEXT 1700 3840 Left 2 !.meas TRAN P_puente     AVG V(ACLO,VRAW)*I(D_B1)+V(ACHI,VRAW)*I(D_B2)-V(ACHI)*I(D_B3)-V(ACLO)*I(D_B4) FROM {TM1} TO {TM2}\n.meas TRAN P_sec        AVG V(NS1,TAP2)*I(Rs1)+V(NS2,TAP1)*I(Rs2)+V(NS3,ACLO)*I(Rs3) FROM {TM1} TO {TM2}\n.meas TRAN P_prim       AVG V(NP1,NEUTRAL)*I(Rp1)+V(NP2,NEUTRAL)*I(Rp2)+V(NP3,NEUTRAL)*I(Rp3) FROM {TM1} TO {TM2}
TEXT -406 484 Left 2 ;1. RED 230 Vca
TEXT 144 -92 Left 2 ;2. TRES TRANSFORMADORES ~13 Vrms EN SERIE + SELECTOR DE TOMAS 1P3T
TEXT 1424 484 Left 2 ;4. PUENTE Y DEPOSITO
TEXT 2600 218 Left 2 ;5. LM317HV:  Vout = 1,25*(R2c+R2f)/R1  (0 V con el pote a cero)
TEXT 4120 1482 Left 2 ;5b. SUMIDERO DE CARGA MINIMA - lo que libera al pote (Q1 del P223)
TEXT 3384 484 Left 2 ;7. SALIDA
TEXT 1384 1888 Left 2 ;8. REFERENCIA 2,5 V Y CONSIGNA DE CORRIENTE
TEXT 2604 1824 Left 2 ;9. LAZO DE CORRIENTE - el operacional tira de ADJ (fig. 31 + 32)
TEXT 1184 2708 Left 2 ;8b. REFERENCIA NEGATIVA - permite 0 V y CC hasta el corto franco
TEXT 4104 2468 Left 2 ;10. MANDOS
TEXT -56 2792 Left 2 ;MODELO TERMICO - no es circuito, es instrumentacion (1 V = 1 C)
LINE Normal 600 168 600 264
LINE Normal 616 168 616 264
LINE Normal 600 728 600 824
LINE Normal 616 728 616 824
LINE Normal 600 1288 600 1384
LINE Normal 616 1288 616 1384
RECTANGLE Normal -430 456 -56 1090 2
RECTANGLE Normal 120 -120 1396 1648 2
RECTANGLE Normal 1400 456 2544 1270 2
RECTANGLE Normal 2576 190 3324 1370 2
RECTANGLE Normal 4096 1454 4552 2140 2
RECTANGLE Normal 3360 456 3884 1270 2
RECTANGLE Normal 1360 1860 2444 2630 2
RECTANGLE Normal 2580 1796 3340 2610 2
RECTANGLE Normal 1160 2680 2090 3330 2
RECTANGLE Normal 4080 2440 4624 2970 2
RECTANGLE Normal -80 2764 1044 3250 2

The netlist it stands for:
* psu_cvcc.asc
V1 LIVE NEUTRAL SINE(0 325 50)
Rgnd NEUTRAL 0 1G
RF1 LIVE LP1 0.5m
Lp1 LP1 NP1 50
Rp1 NP1 NEUTRAL 70
Ls1 TAP3 NS1 160m
Rs1 NS1 TAP2 0.18
RF2 LIVE LP2 0.5m
Lp2 LP2 NP2 50
Rp2 NP2 NEUTRAL 70
Ls2 TAP2 NS2 160m
Rs2 NS2 TAP1 0.18
RF3 LIVE LP3 0.5m
Lp3 LP3 NP3 50
Rp3 NP3 NEUTRAL 70
Ls3 TAP1 NS3 160m
Rs3 NS3 ACLO 0.18
XSW1 ACHI TAP1 TAP2 TAP3 PSEL 1P3T_ SET={TAP} Ron=10m  ; pins ? ? ? ? P
D_B2 ACHI VRAW 1N5408
D_B3 0 ACHI 1N5408
D_B1 ACLO VRAW 1N5408
D_B4 0 ACLO 1N5408
Cbulk VRAW 0 10000u
Rbleed VRAW 0 10k
Cin VRAW 0 0.1u
Csnub ACHI NSNUB 0.1u
Rsnub NSNUB ACLO 100
XU1 VADJ VOUT VRAW LM317HV  ; pins ADJ OUT IN
R1 VOUT VR1T 270
R§TP1 VR1T VADJ 70
R2c VADJ VMIDP R=max(V(VSET)*10000,0.1)
R2f VMIDP VREF_-1v25 R=max(V(VSETF)*1000,0.1)
Cadj VADJ VNEG 1u
Cout VOUT 0 10u
Cout_hf VOUT 0 100n
D_IN VOUT VRAW 1N5408
D_ADJ VADJ VOUT 1N4148
D_REV 0 VOUT 1N5408
Rb_min VNEG BMIN 1k
Q_min VOUT BMIN EMIN 0 QNPN
Re_min EMIN VNRAW 1300
Rload VOUT VRTN R=limit(V(LOAD),0.01,1Meg)
Rshunt VRTN 0 0.33
Rfilt VRTN SENSE 1k
Cfilt SENSE 0 100n
Vload LOAD 0 100
Vaux VCC 0 12
Rref VCC VREF_2v5 2k2
Xref VREF_2v5 0 VREF_2v5 TL431ED  ; pins CATHODE ANODE REF
Cref VREF_2v5 0 100n
Rset VREF_2v5 ISET 22k
Rpot_i ISET 0 R=V(ISETADJ)*4700
Cpot_i ISET 0 100n
Qcc VADJ CCB VNEG 0 QNPN
Rb CCOUT CCB 4k7
XU2 SENSE CCIN VCC VNEG CCOUT LM358  ; pins In+ In- V+ V- OUT
Rint CCIN ISET 10k
Cint CCOUT CCIN 1u
Rbe CCB VNEG 10k
Vneg VNEG 0 -5
Vnraw VNRAW 0 -17
XU3 VRTN VREF_-1v25 VNRAW LM337  ; pins ADJ OUT IN
Rnbleed 0 VREF_-1v25 220
Vset VSET 0 0.5
Vsetf VSETF 0 0.5
Visetadj ISETADJ 0 1
Vamb AMB 0 25
Rth_sa TSINK AMB 2
Cth_sa TSINK AMB 20
Rth_js Tj TSINK 2.3
Cth_js Tj TSINK 0.02
Bheat AMB Tj I=limit((V(VRAW)-V(VOUT))*abs(I(Rshunt)+I(R1)+Ic(Q_min)),0,500)
.model D D
.lib standard.dio
.model NPN NPN
.model PNP PNP
.lib standard.bjt
* Rgnd solo ata el neutro
* a la masa del simulador.
* TRAFO 1
* TRAFO 2
* TRAFO 3
* SET sale del .param TAP: 1, 2 o 3.
* PSEL es el nodo de mando interno del modelo.
* amortiguador del secundario
* EN LA PLACA: dejar pads para un filtro CRC (Rcrc en serie en
* el rail con puente de 0 ohm, Cbulk2 en paralelo a la entrada).
* NO va montado: el rizado sin el ya esta dentro de spec comercial
* y la mejora cabe dentro del error del modelo.  Se decide MIDIENDO
* la unidad construida.  Valores medidos, en el README.
* R2c+R2f = dos potes de PANEL en serie (10k grueso + 1000 fino), 149 mW en total.
* R2 a VREF_-1v25 = VRTN - 1,25 (cero a 0 V).  Cadj a -5 V (S.Chip): 80 dB (fig. 21).
* R1+TP1 = 340 ohm fija la ESCALA, no la carga minima: de eso se encarga Q_min.
* TP1 ajusta el fondo de escala (potes de panel: +-20 %).  Subirla lo baja.
* Los tres diodos son la fig. 15: obligatorios con Vout > 25 V.
* Dos mandos independientes: VSET mueve el grueso y VSETF el fino.
* Lo que ve el circuito es la SUMA de los dos.
* Q_min = BD139 (TO-126): 8.8 mA, 0.40 W en el peor caso.
* Re_min 1300 ohm / 3 W: acota el fallo en corto a 44 mA y 2.5 W.
* Con el, la carga minima ya no depende de R1 ni del pote.
* shunt en el RETORNO (fig. 32) -> SENSE al lazo
* Vaux = trafo auxiliar de 1,5 VA + puente + 7812
* 0..0,44 V en ISET  ->  limite de 0 a 1,33 A
* Integrador a 16 Hz. Mientras no limita, CCOUT=0 y Qcc esta cortado.
* Qcc: BC546 (Vceo 65 V). Su colector ve VADJ, hasta 40 V.
* Emisor y Rbe en VNEG (-5 V): con ellos en la referencia, Qcc se satura.
* Vnraw = bruto del auxiliar (-17 V), ANTES del 79L05: el retorno de Q_min.
* Vneg  = -5 V del auxiliar (79L05), V- del LM358 y base de Q_min.
* U3 = LM337 a -1,25 V (como el P223): pata de referencia en VRTN.
* Su corriente vuelve al COMUN, no por el shunt: tension Y corriente exactas.
* Rnbleed 220 ohm (el valor del P223) le da su carga minima.
* Qcc NO tira contra esta referencia sino contra los -5 V (como Silicon
* Chip): contra -1,25 se satura y pierde el CC en un corto franco.
* Vset 0..1 = pote GRUESO, 0..10000 ohm
* Vsetf 0..1 = pote FINO, 0..1000 ohm  (3.7 V de recorrido)
* Visetadj 0..1 = pote de corriente 0..4k7
* Rth_js 2,3 C/W (TO-220) + Rth_sa 2 C/W (disipador).
* === DIRECTIVAS ===
.param TAP=2
.lib 1P3T_.sub
.lib LM337.sub
K1 Lp1 Ls1 0.999
K2 Lp2 Ls2 0.999
K3 Lp3 Ls3 0.999
.global Tj
.model 1N5408 D(Is=63.0n Rs=14.1m Bv=1000 Ibv=10u Cjo=53p M=0.333 N=1.30 Eg=1.11)
.model 1N4148 D(Is=2.52n Rs=0.568 N=1.752 Cjo=4p M=0.4 tt=20n Iave=200m Vpk=75)
.model QNPN NPN(IS=1e-14 BF=200 VAF=100 RB=10 RC=1 CJE=11p CJC=4p TF=1n)
.lib LM317HV.sub
.lib TL431ED.sub
.lib LM358.sub
.ic V(Tj)=25 V(TSINK)=25
.options reltol=1e-3 abstol=1u vntol=1u
.tran 0 1.5 0 100u startup uic
* psu_cvcc - Fuente lineal DIY con LM317HV, CV y CC ajustables
* Circuitos de aplicacion de TI SNVS773D rev D.
* Protecciones de sobrecorriente, cortocircuito y
* sobretemperatura: las NATIVAS del chip.
* uic NO es opcional: sin el, el .op sale NaN.
* Los detalles estan en el README del directorio.
* OJO 1: el pote llega a 40,6 V en cualquier toma. Con TAP=1 o
* TAP=2, pasado el tope, el regulador entra en DROPOUT.
* OJO 2: en TAP=3, en vacio y con la red a 253 V, el diferencial
* llega a 59,1 V contra los 60 V del MAXIMO ABSOLUTO (8.3.2).
* NO bajar del 20 % del pote estando en TAP=3.  Decision tomada
* a sabiendas: tres devanados de 13 V no caben con margen.
* === INSTRUMENTACION: los resultados salen en el .log (Ctrl+L) ===
.param TM1=1.2 TM2=1.5
.meas TRAN Vout_dc      AVG V(VOUT,VRTN)           FROM {TM1} TO {TM2}
.meas TRAN Vout_pp      PP  V(VOUT,VRTN)           FROM {TM1} TO {TM2}
.meas TRAN Vout_min     MIN V(VOUT,VRTN)           FROM {TM1} TO {TM2}
.meas TRAN Vout_pico    MAX V(VOUT,VRTN)           FROM 0 TO {TM2}
.meas TRAN Iout_dc      AVG I(Rshunt)              FROM {TM1} TO {TM2}
.meas TRAN Iload_dc     AVG I(Rload)               FROM {TM1} TO {TM2}
.meas TRAN I_div        AVG I(R2c)                 FROM {TM1} TO {TM2}
.meas TRAN Iout_pp      PP  I(Rshunt)              FROM {TM1} TO {TM2}
.meas TRAN Vraw_dc      AVG V(VRAW)                FROM {TM1} TO {TM2}
.meas TRAN Vraw_pp      PP  V(VRAW)                FROM {TM1} TO {TM2}
.meas TRAN Headroom     MIN V(VRAW)-V(VOUT)        FROM {TM1} TO {TM2}
.meas TRAN Rechazo_dB   PARAM 20*log10(Vraw_pp/max(Vout_pp,1n))
.meas TRAN Vadj_dc      AVG V(VADJ)                FROM {TM1} TO {TM2}
.meas TRAN Vnref_dc     AVG V(VREF_-1v25)               FROM {TM1} TO {TM2}
.meas TRAN Vref_2v5_dc  AVG V(VREF_2v5)              FROM {TM1} TO {TM2}
.meas TRAN V_iset       AVG V(ISET)                FROM {TM1} TO {TM2}
.meas TRAN V_sense      AVG V(SENSE)               FROM {TM1} TO {TM2}
.meas TRAN CCout        AVG V(CCOUT)               FROM {TM1} TO {TM2}
.meas TRAN Ic_Qcc       AVG Ic(Qcc)                FROM {TM1} TO {TM2}
.meas TRAN En_CC        PARAM if(Ic_Qcc>1m,1,0)
.meas TRAN Ilim_A       PARAM V_iset/0.33
.meas TRAN I_aux        AVG -I(Vaux)               FROM {TM1} TO {TM2}
.meas TRAN Ipk_diodo    MAX I(D_B2)                FROM {TM1} TO {TM2}
.meas TRAN Irms_sec     RMS I(Rs3)                 FROM {TM1} TO {TM2}
.meas TRAN Tj_med       AVG V(Tj)                  FROM {TM1} TO {TM2}
.meas TRAN Tj_max       MAX V(Tj)                  FROM 0 TO {TM2}
.meas TRAN Tsink        AVG V(TSINK)               FROM {TM1} TO {TM2}
.meas TRAN Margen_Tj    PARAM 125-Tj_max
.meas TRAN P_LM317      AVG (V(VRAW)-V(VOUT))*(I(Rshunt)+I(R1)+Ic(Q_min)) FROM {TM1} TO {TM2}
.meas TRAN P_LM317_pk   MAX (V(VRAW)-V(VOUT))*(I(Rshunt)+I(R1)+Ic(Q_min)) FROM {TM1} TO {TM2}
.meas TRAN P_Rshunt     AVG V(VRTN)*I(Rshunt)      FROM {TM1} TO {TM2}
.meas TRAN P_R1         AVG V(VOUT,VR1T)*I(R1)     FROM {TM1} TO {TM2}
.meas TRAN P_TP1        AVG V(VR1T,VADJ)*I(RTP1)   FROM {TM1} TO {TM2}
.meas TRAN P_R2c        AVG V(VADJ,VMIDP)*I(R2c)   FROM {TM1} TO {TM2}
.meas TRAN P_R2f        AVG V(VMIDP,VREF_-1v25)*I(R2f)  FROM {TM1} TO {TM2}
.meas TRAN I_min        AVG Ic(Q_min)              FROM {TM1} TO {TM2}
.meas TRAN I_minload    PARAM I_div+I_min
.meas TRAN P_Q_min      AVG V(VOUT,EMIN)*Ic(Q_min) FROM {TM1} TO {TM2}
.meas TRAN P_Re_min     AVG V(EMIN,VNRAW)*I(Re_min) FROM {TM1} TO {TM2}
.meas TRAN Vce_Q_min    MAX V(VOUT,EMIN)           FROM 0 TO {TM2}
.meas TRAN P_Rbleed     AVG V(VRAW)*I(Rbleed)      FROM {TM1} TO {TM2}
.meas TRAN P_Rsnub      AVG V(NSNUB,ACLO)*I(Rsnub) FROM {TM1} TO {TM2}
.meas TRAN P_Rfilt      AVG V(VRTN,SENSE)*I(Rfilt) FROM {TM1} TO {TM2}
.meas TRAN P_Rref       AVG V(VCC,VREF_2v5)*I(Rref)  FROM {TM1} TO {TM2}
.meas TRAN P_Rset       AVG V(VREF_2v5,ISET)*I(Rset) FROM {TM1} TO {TM2}
.meas TRAN P_Rpot_i     AVG V(ISET)*I(Rpot_i)      FROM {TM1} TO {TM2}
.meas TRAN P_Rb         AVG V(CCOUT,CCB)*I(Rb)     FROM {TM1} TO {TM2}
.meas TRAN P_Rbe        AVG V(CCB,VNEG)*I(Rbe)     FROM {TM1} TO {TM2}
.meas TRAN P_Qcc        AVG V(VADJ,VNEG)*Ic(Qcc)   FROM {TM1} TO {TM2}
.meas TRAN P_Rint       AVG V(CCIN,ISET)*I(Rint)   FROM {TM1} TO {TM2}
.meas TRAN P_Rnbleed    AVG V(VREF_-1v25)*I(Rnbleed)    FROM {TM1} TO {TM2}
.meas TRAN Vc_bulk      MAX abs(V(VRAW))           FROM 0 TO {TM2}
.meas TRAN Vc_in        MAX abs(V(VRAW))           FROM 0 TO {TM2}
.meas TRAN Vc_snub      MAX abs(V(ACHI,NSNUB))     FROM 0 TO {TM2}
.meas TRAN Vc_adj       MAX abs(V(VADJ,VNEG))      FROM 0 TO {TM2}
.meas TRAN Vc_out       MAX abs(V(VOUT))           FROM 0 TO {TM2}
.meas TRAN Vc_filt      MAX abs(V(SENSE))          FROM 0 TO {TM2}
.meas TRAN Vc_ref       MAX abs(V(VREF_2v5))         FROM 0 TO {TM2}
.meas TRAN Vc_pot_i     MAX abs(V(ISET))           FROM 0 TO {TM2}
.meas TRAN Vc_int_max   MAX V(CCOUT,CCIN)          FROM 0 TO {TM2}
.meas TRAN Vc_int_min   MIN V(CCOUT,CCIN)          FROM 0 TO {TM2}
.meas TRAN Vce_Qcc      MAX V(VADJ,VNEG)           FROM 0 TO {TM2}
.meas TRAN Ipk_D_REV    MAX abs(I(D_REV))          FROM 0 TO {TM2}
.meas TRAN Ipk_D_IN     MAX abs(I(D_IN))           FROM 0 TO {TM2}
.meas TRAN Ipk_D_ADJ    MAX abs(I(D_ADJ))          FROM 0 TO {TM2}
.meas TRAN P_puente     AVG V(ACLO,VRAW)*I(D_B1)+V(ACHI,VRAW)*I(D_B2)-V(ACHI)*I(D_B3)-V(ACLO)*I(D_B4) FROM {TM1} TO {TM2}
.meas TRAN P_sec        AVG V(NS1,TAP2)*I(Rs1)+V(NS2,TAP1)*I(Rs2)+V(NS3,ACLO)*I(Rs3) FROM {TM1} TO {TM2}
.meas TRAN P_prim       AVG V(NP1,NEUTRAL)*I(Rp1)+V(NP2,NEUTRAL)*I(Rp2)+V(NP3,NEUTRAL)*I(Rp3) FROM {TM1} TO {TM2}
* 1. RED 230 Vca
* 2. TRES TRANSFORMADORES ~13 Vrms EN SERIE + SELECTOR DE TOMAS 1P3T
* 4. PUENTE Y DEPOSITO
* 5. LM317HV:  Vout = 1,25*(R2c+R2f)/R1  (0 V con el pote a cero)
* 5b. SUMIDERO DE CARGA MINIMA - lo que libera al pote (Q1 del P223)
* 7. SALIDA
* 8. REFERENCIA 2,5 V Y CONSIGNA DE CORRIENTE
* 9. LAZO DE CORRIENTE - el operacional tira de ADJ (fig. 31 + 32)
* 8b. REFERENCIA NEGATIVA - permite 0 V y CC hasta el corto franco
* 10. MANDOS
* MODELO TERMICO - no es circuito, es instrumentacion (1 V = 1 C)
.lib 1P3T_.SUB
.backanno
.end